# Altium schematic sheet LevelTranslator.SchDoc
size A; SheetNumber: 1; SheetTotal: 1
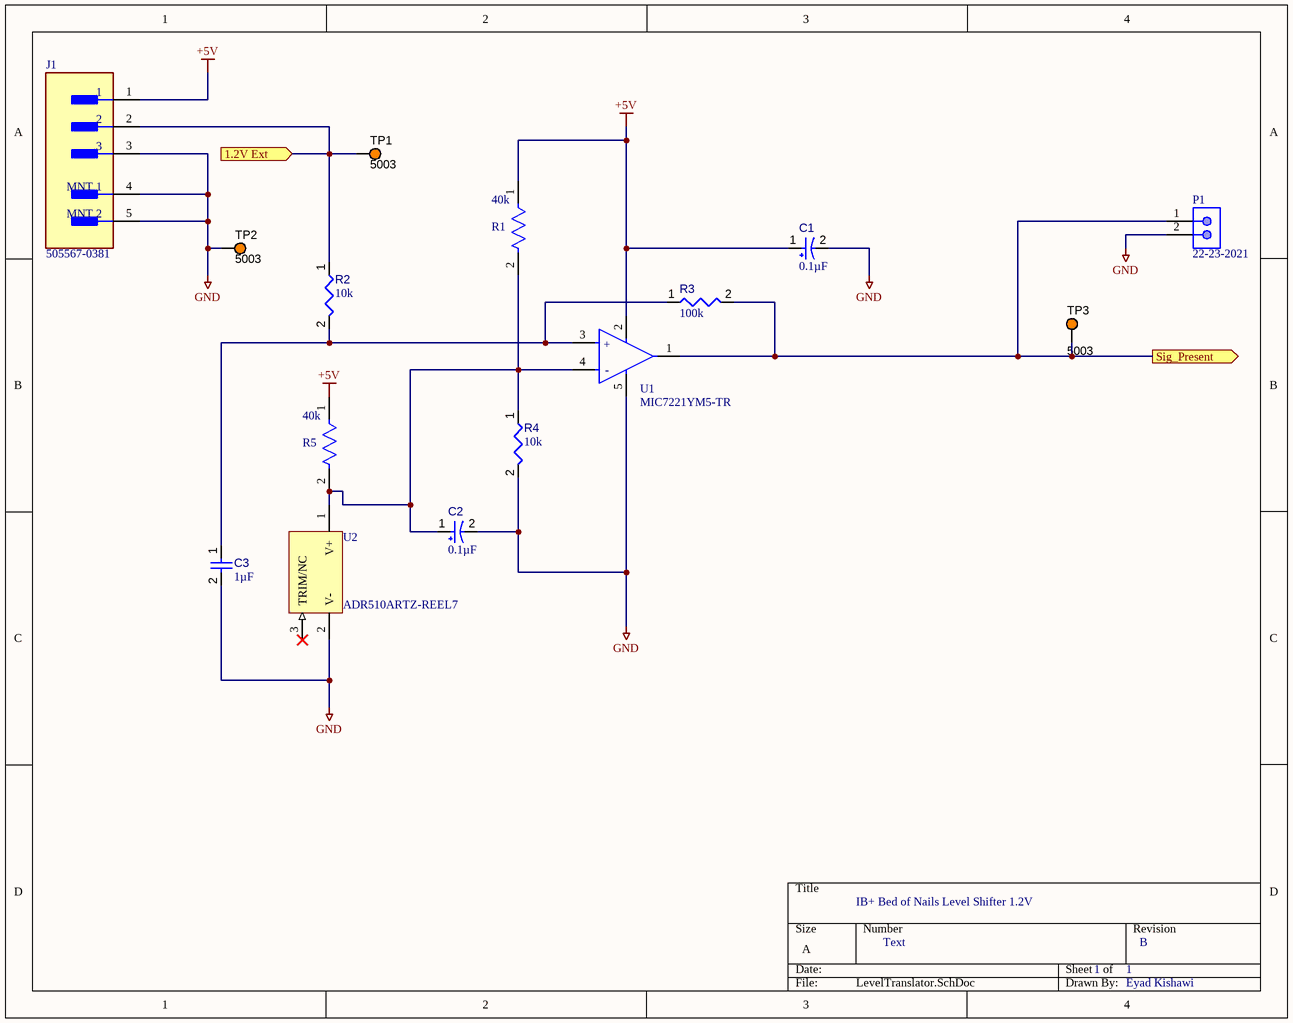
[diagram p0: LevelTranslator.SchDoc]

## Parts
C1  value 0.1µF  [VISH-TR3-A_V]  (hidden comment: TR3A105K035C3000)
C2  value 0.1µF  [VISH-TR3-A_V]  (hidden comment: TR3A105K035C3000)
C3  value 1µF  [CAPC1608X90X35ML15T15]  (hidden comment: Capacitor 1uF +/- 10% 16V 0603)
J1  505567-0381  [FP-505567-0381-MFG]
P1  22-23-2021  [MOLX-22-23-2021_V]
R1  Resistance: 40k  [FP-RC0402-0_4-IPC_C]  (hidden comment: RC0402JR-0710KL)
R2  value 10k  [RESC0402(1005)_L]  (hidden comment: Resistor 10K  +/-1 % 0402 63 mW)
R3  value 100k  [RESC0402(1005)_L]  (hidden comment: 100KR2F)
R4  value 10k  [RESC0402(1005)_L]  (hidden comment: Resistor 10K  +/-1 % 0402 63 mW)
R5  Resistance: 40k  [FP-RC0402-0_4-IPC_C]  (hidden comment: RC0402JR-0710KL)
TP1  5003  [KSTN-5003]
TP2  5003  [KSTN-5003]
TP3  5003  [KSTN-5003]
U1  MIC7221YM5-TR  [FP-SOT23-5LD-PL-1-IPC_B]
U2  ADR510ARTZ-REEL7  [ADI-RT-3_M]

## Ports
1.2V Ext (in), Sig_Present (out)

## Nets
+5V: C1.1 J1.1 R1.1 R5.1 U1.2(V+)
GND: C1.2 C2.2 C3.2 J1.3 J1.4(MNT_1) J1.5(MNT_2) P1.2 R4.2 TP2.1 U1.5(V-) U2.2(V-)
1.2V Ext: J1.2 R2.1 TP1.1 ; port 1.2V Ext
Sig_Present: P1.1 R3.2 TP3.1 U1.1(OUT) ; port Sig_Present
NetC2_1: C2.1 R1.2 R4.1 R5.2 U1.4(IN-) U2.1(V+)
NetC3_1: C3.1 R2.2 R3.1 U1.3(IN+)

Not connected (* = marked no-connect by the designer): U2 3(TRIM/NC)*

## Notes on the sheet
- IB+ Bed of Nails Level Shifter 1.2V
- Text
- 1
- B
- Eyad Kishawi
- (in symbol CMP-016-00010-1) +; -

## Library data of the parts
C1 C2 = CMP-001-00048-7: Solid Tantalum Surface Mount Chip Capacitor, TANTAMOUNT(TM), Molded Case, Low ESR, 1 uF, +/- 10%, 35 V, -55 to 125 degC, 1206 (3216 Metric), RoHS, Tape and Reel; Manufacturer: Vishay Semiconductor; Voltage Rating: 35V; Package Reference: TR3-A; Max Operating Temperature: 125°C; RoHS Compliant: Unknown; Case/Package: TR3-A; Packaging: TapeandReel; Mounting Technology: SM; Manufacturer URL: http://www.vishay.com/; Capacitor Type: Tantalum; Datasheet URL: http://www.vishay.com/docs/40080/tr3.pdf; Tolerance: 10%; Package Description: 2-Pin Surface Mount Device, Body 3.2 x 1.6 mm; Datasheet Version: Aug-16; Min Operating Temperature: -55°C
C3 = CMP-001-00004-6: Chip Capacitor, 1 uF, +/- 10%, 16 V, 0603 (1608 Metric); Capacitor Type: Ceramic; Mounting Technology: SM; RoHS Compliant: True; Min Operating Temperature: -55°C; Case/Package: 0603; Pins: 2; Voltage Rating: 16V; Max Operating Temperature: 125°C; Tolerance: 10%
J1 = CMP-04776-000604-1: CONN HEADER SMD R/A 3POS 1.25MM
P1 = CMP-1704-00001-3: Male Header, Pitch 2.54 mm, 1 x 2 Position, Height 10.67 mm, Tail Length 3.56 mm, 0 to 75 degC, RoHS, Bulk; Package Quantity: 3000; Height: 10.67 mm; RoHSCompliant: True; ComponentLink2URL: https://datasheet.ciiva.com/19454/232266-19454304.pdf; PartNumber: 22-23-2021; Packaging: Bulk; ComponentLink2Description: Datasheet; Min Operating Temperature: 0 degC; ComponentLink1Description: Manufacturer URL; Length: 5.08 mm; Mounting Technology: Through Hole; Max Operating Temperature: 75 degC; REACH SVHC: Unknown; PackageDescription: Male Header, Pitch 2.54 mm, 1 x 2 Position, Height 10.67 mm, Tail Length 3.56 mm; ComponentLink1URL: http://www.molex.com/; Mount: Through Hole; Radiation Hardening: No; Width: 6.35 mm; Pins: 2
R1 R5 = CMP-2002-07915-3: RES 10K OHM 5% 1/16W 0402; Max Power Dissipation: 63mW; Temperature Coefficient: 100ppm/°C; Power Rating: 62.5mW; Voltage Rating: 50V; Size Code: 0402; Resistance Tolerance: 5%; Packaging: Tape and Reel; Case Code (Metric): 1005; Lead Free: Lead Free; Resistor Type: Thick Film; Min Operating Temperature: -55°C; Military Standard: Not; Depth: 0.5mm; Series: RC; Case/Package: 0402; Construction: Rectangular; Number of Terminations: 2; Package Quantity: 1; Termination: SMD/SMT; Length: 0.039inch; Case Code (Imperial): 0402; Height: 0.016inch; Features: Moisture Resistant; RoHS Compliant: Yes; Max Operating Temperature: 155°C; Tolerance: 5%; Width: 0.02inch
R2 R4 = CMP-009-00149-3: Chip Resistor, 10 kOhms, +/-1 %, 63 mW, -55 to 125 degC, 0402; Power: 63mW; Tolerance: 1%; Min Operating Temperature: -55°C; Case/Package: 0402; Max Operating Temperature: 155°C; Pins: 2
R3 = CMP-009-00064-2: 100K 0.063W 1% 0402 (1005 Metric)  SMD; Power: 63mW; Case/Package: 0402; Mounting Technology: SMT; Pins: 2; Tolerance: 1%
TP1-TP3 = CMP-002-00037-2: Test Point, Orange, Height 4.6 mm, Tail Length 3 mm, 1-Pin THD, RoHS; Manufacturer: Keystone; Colour: Orange; Packaging: Bulk; Package Description: 1-Pin Through Hole Device, Dia 2.54 mm; Pins: 1; Package Reference: 5003; Datasheet Version: Jun-15; Case/Package: 5003; Mounting Technology: TH; Connector Type: TestPoint; Diameter: 2.54mm; Contact Material: Bronze; Datasheet URL: http://keyelco.com/userAssets/file/M65p56.pdf; Manufacturer URL: http://www.keyelco.com/; Package Quantity: 10; Contact Plating: Tin; RoHS Compliant: True
U1 = CMP-016-00010-1: Comparator, 1 Func, 10000uV Offset-Max, 75ns Response Time, CMOS, PDSO5; Nominal Supply Voltage: 2.7V; Min Operating Temperature: -40°C; Case/Package: LSSOP; RoHS Compliant: Yes; Pins: 5; Max Operating Temperature: 85°C
U2 = CMP-0784-00413-1: Precision Low Noise Shunt Voltage Reference, 1 V Output, Industrial, 3-pin SOT23 (RT-3), Reel; Manufacturer: Analog Devices; Ref Out TC (ppm/C): 85; Vout: 1V; ComponentLink4URL: Product URL:http://www.analog.com/en/special-linear-functions/voltage-references/adr510/products/product.html; ComponentLink1URL: http://www.analog.com/en/index.html; Mounting Technology: Surface Mount; PackageVersion: 011909-C, 02/2009; ComponentLink2URL: http://www.analog.com/static/imported-files/data_sheets/ADR510.pdf; PartNumber: ADR510ARTZ-REEL7; Code_JEDEC: TO-236-AB; ComponentLink3Description: Package Specification; PackageDescription: 3-Pin Small Outline Transistor Package, Body 2.9 x 1.3 mm, Pitch 0.96 mm; PackageReference: RT-3; ComponentLink2Description: Datasheet; DatasheetVersion: Rev. B; Operating Temp Range: -40 to 85 degC; Packing: Reel; ComponentLink1Description: Manufacturer URL; ComponentLink3URL: http:/www.analog.com/static/imported-files/packages/PKG_PDF/SOT-23-3 (RT)/RT_3.pdf; ComponentLink4Description: URL Link1